# Altium schematic sheet Tarjeta Telemining V1.1 - PCB.SchDoc
size A3
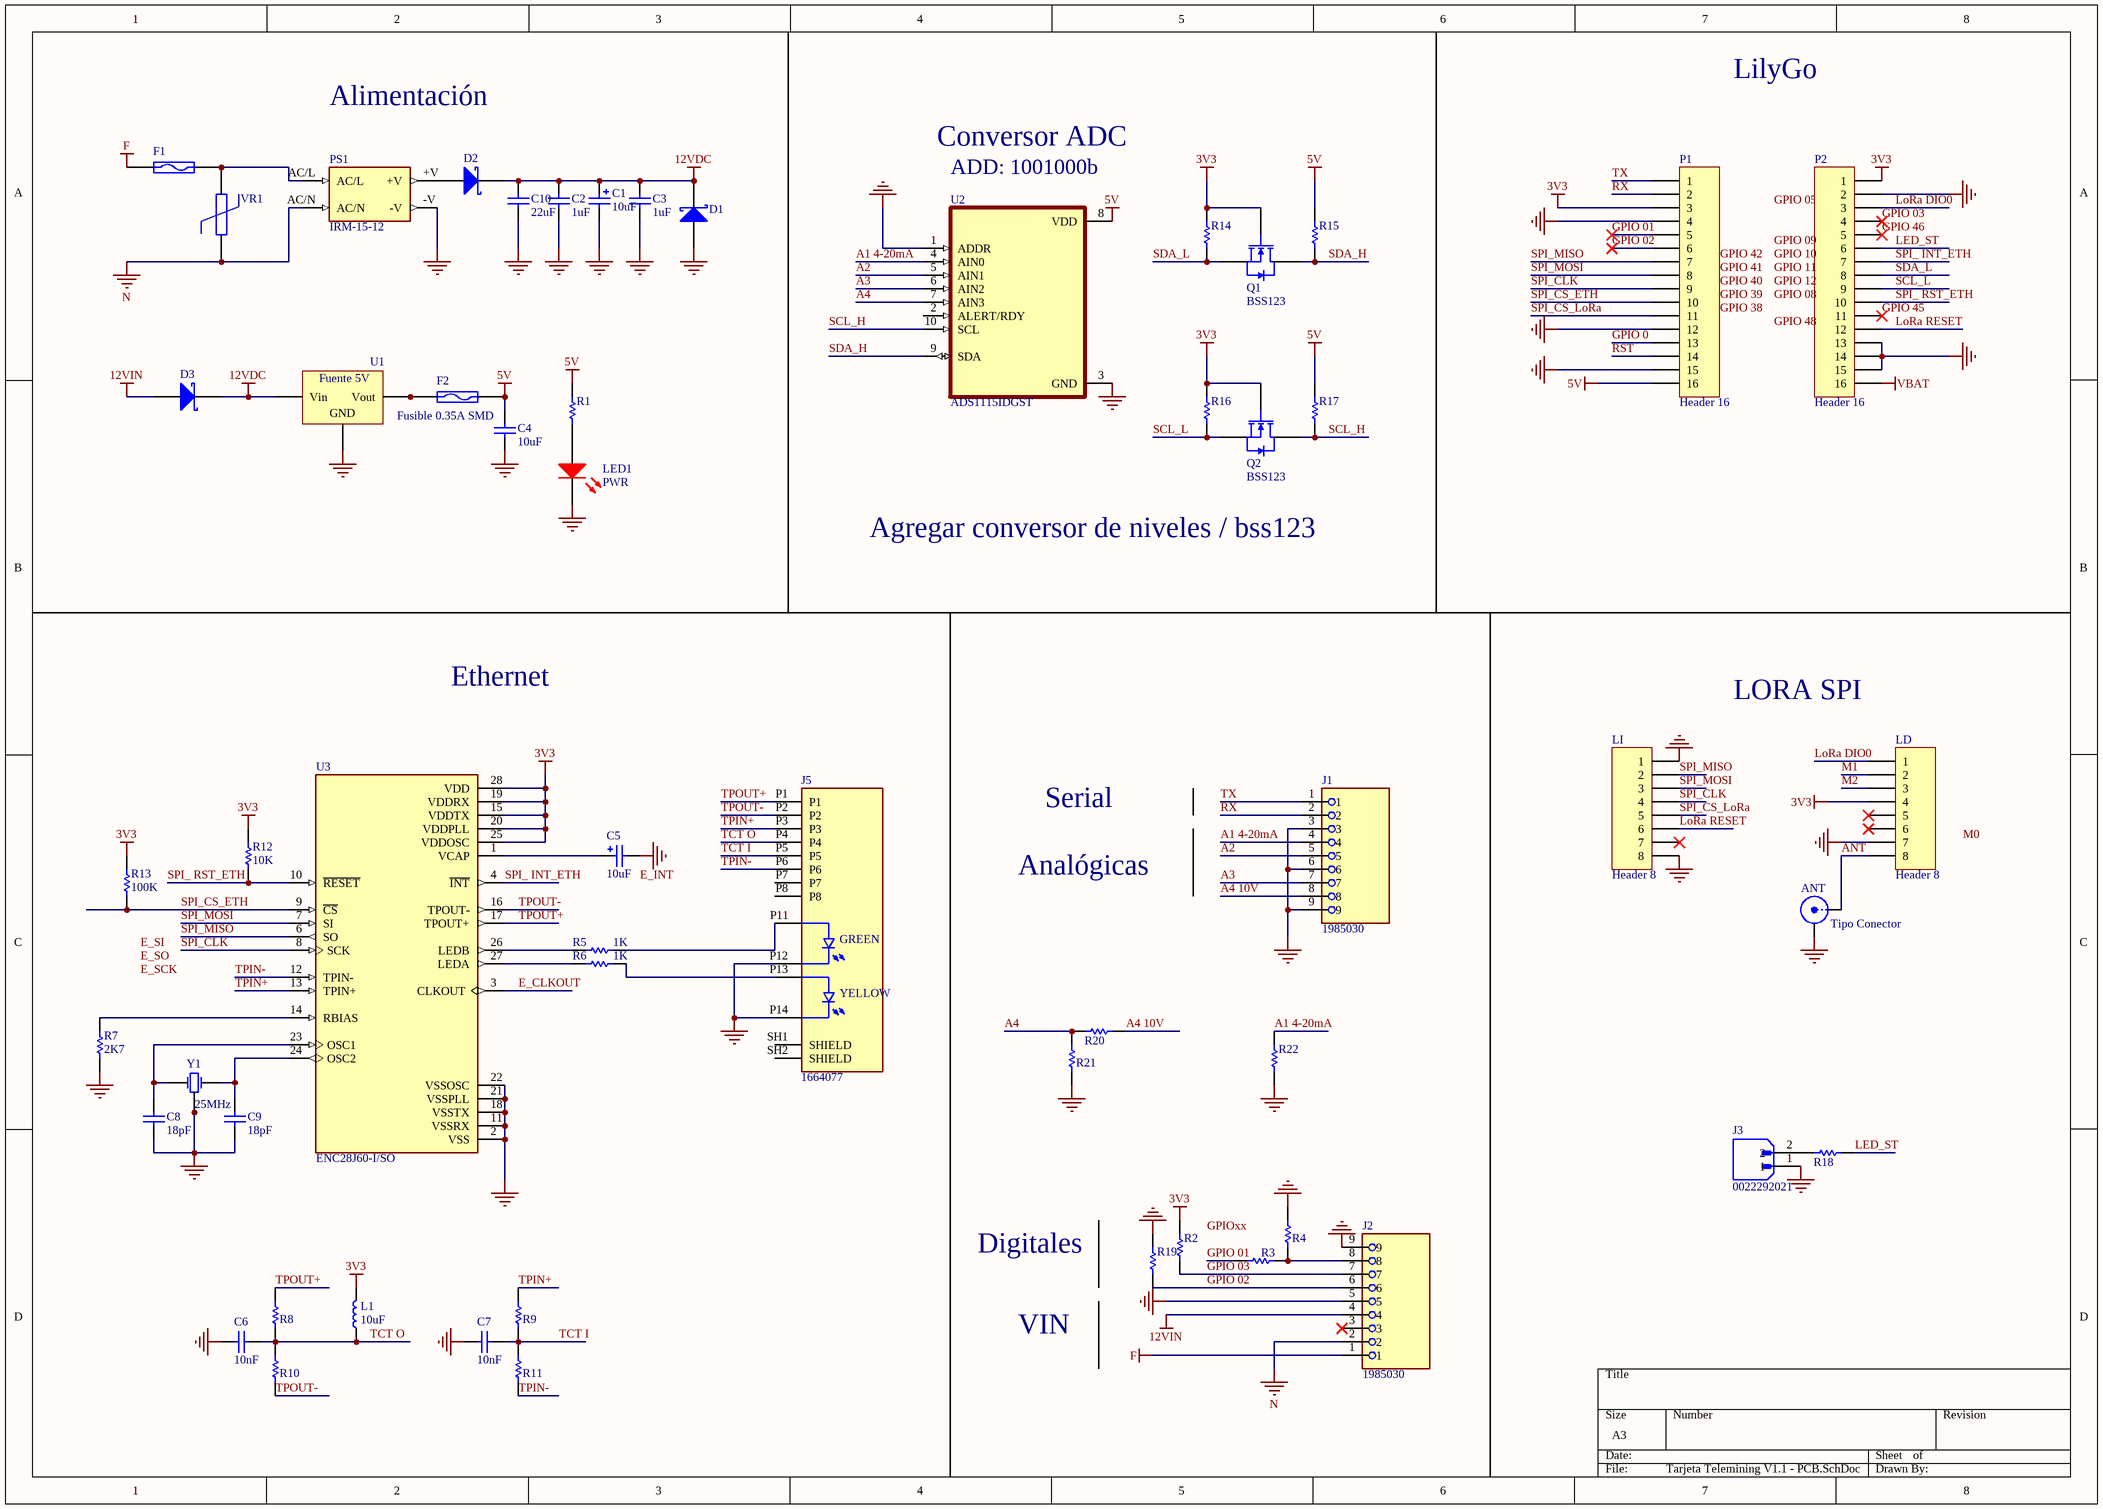
[diagram p0: Tarjeta Telemining V1.1 - PCB.SchDoc]

## Parts
ANT  Tipo Conector  [UFL]
C1  10uF  [Cap tant 10uF 1206 SMD]
C2  1uF  [Cap 1uF 0805 SMD]
C3  1uF  [Cap 1uF 0805 SMD]
C4  10uF  [Cap 10uF 1206 SMD]
C5  10uF  [Cap tant 10uF 1206 SMD]
C6  10nF  [Cap 0.1uF 0603 SMD]
C7  10nF  [Cap 0.1uF 0603 SMD]
C8  18pF  [Cap 0.1uF 0603 SMD]
C9  18pF  [Cap 0.1uF 0603 SMD]
C10  22uF  [Cap 22uF 1206 SMD]
D1  Diodo TVS SMD SMBJ20A  [Diodo TVS SMD SMBJ20A]  (value not drawn)
D2  Diodo Schottky SMD  [Diodo CDBA340-G DO-214AC SMD]  (value not drawn)
D3  Diodo Schottky SMD  [Diodo CDBA340-G DO-214AC SMD]  (value not drawn)
F1  Fuse 3A/300V TH  [Fuse 3A/300V TH]  (value not drawn)
F2  Fusible 0.35A SMD  [FUSE 0805 SMD]
J1  1985030  [PHOENIX_1985030]
J2  1985030  [PHOENIX_1985030]
J3  0022292021  [MOLEX_0022292021]
J5  1664077  [PHOENIX_1664077]
L1  10uF  [Ferrita 3A 30 Ohm 0805]
LD  Header 8  [Header M8]
LED1  PWR  [LED Rojo 0603]
LI  Header 8  [Header M8]
P1  Header 16  [HDR1X16]
P2  Header 16  [HDR1X16]
PS1  IRM-15-12  [CONV_IRM-15-12]
Q1  BSS123  [MOSFET BSS123  SMD SOT-23]
Q2  BSS123  [MOSFET BSS123  SMD SOT-23]
R1  1K  [Res 1K 0603 1/8W]  (value not drawn)
R2  1K  [Res 1K 0603 1/8W]  (value not drawn)
R3  1K  [Res 1K 0603 1/8W]  (value not drawn)
R4  1K  [Res 1K 0603 1/8W]  (value not drawn)
R5  1K  [Res 1K 0603 1/8W]
R6  1K  [Res 1K 0603 1/8W]
R7  2K7  [Res 1K 0603 1/8W]
R8  50R 1%  [Res 1K 0603 1/8W]  (value not drawn)
R9  50R 1%  [Res 1K 0603 1/8W]  (value not drawn)
R10  50R 1%  [Res 1K 0603 1/8W]  (value not drawn)
R11  50R 1%  [Res 1K 0603 1/8W]  (value not drawn)
R12  10K  [Res 1K 0603 1/8W]
R13  100K  [Res 1K 0603 1/8W]
R14  10K  [Res 1K 0603 1/8W]  (value not drawn)
R15  10K  [Res 1K 0603 1/8W]  (value not drawn)
R16  10K  [Res 1K 0603 1/8W]  (value not drawn)
R17  10K  [Res 1K 0603 1/8W]  (value not drawn)
R18  1K  [Res 1K 0603 1/8W]  (value not drawn)
R19  10K  [Res 1K 0603 1/8W]  (value not drawn)
R20  100K  [Res 1K 0603 1/8W]  (value not drawn)
R21  100K  [Res 1K 0603 1/8W]  (value not drawn)
R22  10K  [Res 1K 0603 1/8W]  (value not drawn)
U1  OKI-78SR series non-isolated switching regulator  [Reg DC/DC OKI-78SR TH]  (value not drawn)
U2  ADS1115IDGST  [SOP50P490X110-10N]
U3  ENC28J60-I/SO  [SOIC127P1030X265-28N]
VR1  VARISTOR B72210S0351K101  [VARISTOR  B72210S0351K101]  (value not drawn)
Y1  25MHz  [XTAL 24MHz SMD]

## Nets
3V3: L1.2 LD.4 P1.3 P2.1 Q1.1(G) Q2.1(G) R2.2 R12.1 R13.1 R14.2 R16.2 U3.15(VDDTX) U3.19(VDDRX) U3.20(VDDPLL) U3.25(VDDOSC) U3.28(VDD)
5V: C4.2 F2.2 P1.16 R1.2 R15.2 R17.2 U2.8(VDD)
12VDC: C1.1 C2.2 C3.2 C10.2 D1.2(K) D2.2(K) D3.2(K) U1.1(Vin)
12VIN: D3.1(A) J2.4
F: F1.1 J2.1
GND: ANT.2(Y) C1.2 C2.1 C3.1 C4.1 C5.2 C6.2 C7.2 C8.1 C9.1 C10.1 D1.1(A) J1.3 J1.6 J1.9 J2.5 J2.9 J3.1 J5.P12 J5.P14 LD.7 LED1.2(K) LI.1 LI.8 P1.4 P1.12 P1.15 P2.2 P2.13 P2.14 P2.15 PS1.-V R4.2 R7.2 R19.2 R21.2 R22.1 U1.2(GND) U2.1(ADDR) U2.3(GND) U3.2(VSS) U3.11(VSSRX) U3.18(VSSTX) U3.21(VSSPLL) U3.22(VSSOSC) Y1.2(OSC2) Y1.4(OSC2)
N: J2.2 PS1.AC/N VR1.1
VBAT: P2.16
A1 4-20mA: J1.4 R22.2 U2.4(AIN0)
A2: J1.5 U2.5(AIN1)
A3: J1.7 U2.6(AIN2)
A4: R20.1 R21.1 U2.7(AIN3)
A4 10V: J1.8 R20.2
ANT: ANT.1(X) LD.8
E_CLKOUT: U3.3(CLKOUT)
GPIO 0: P1.13
GPIO 01: P1.5 R3.2
GPIO 02: J2.6 P1.6 R19.1
GPIO 03: J2.7 P2.4 R2.1
GPIO 45: P2.11
GPIO 46: P2.5
LED_ST: P2.6 R18.2
LoRa DIO0: LD.1 P2.3
LoRa RESET: LI.6 P2.12
M1: LD.2
M2: LD.3
RST: P1.14
RX: J1.2 P1.2
SCL_H: Q2.3(D) R17.1 U2.10(SCL)
SCL_L: P2.9 Q2.2(S) R16.1
SDA_H: Q1.3(D) R15.1 U2.9(SDA)
SDA_L: P2.8 Q1.2(S) R14.1
SPI_ INT_ETH: P2.7 U3.4(~{INT})
SPI_ RST_ETH: P2.10 R12.2 U3.10(~{RESET})
SPI_CLK: LI.4 P1.9 U3.8(SCK)
SPI_CS_ETH: P1.10 R13.2 U3.9(~{CS})
SPI_CS_LoRa: LI.5 P1.11
SPI_MISO: LI.2 P1.7 U3.6(SO)
SPI_MOSI: LI.3 P1.8 U3.7(SI)
TCT I: C7.1 J5.P5 R9.1 R11.2
TCT O: C6.1 J5.P4 L1.1 R8.1 R10.2
TPIN+: J5.P3 R9.2 U3.13(TPIN+)
TPIN-: J5.P6 R11.1 U3.12(TPIN-)
TPOUT+: J5.P1 R8.2 U3.17(TPOUT+)
TPOUT-: J5.P2 R10.1 U3.16(TPOUT-)
TX: J1.1 P1.1
NetC5_1: C5.1 U3.1(VCAP)
NetC8_2: C8.2 U3.23(OSC1) Y1.1(OSC2)
NetC9_2: C9.2 U3.24(OSC2) Y1.3(OSC1)
NetD2_1: D2.1(A) PS1.+V
NetF1_2: F1.2 PS1.AC/L VR1.2
NetF2_1: F2.1 U1.3(Vout)
NetJ2_8: J2.8 R3.1 R4.1
NetJ3_2: J3.2 R18.1
NetJ5_P11: J5.P11 R5.1
NetJ5_P13: J5.P13 R6.1
NetLED1_1: LED1.1(A) R1.1
NetR5_2: R5.2 U3.26(LEDB)
NetR6_2: R6.2 U3.27(LEDA)
NetR7_1: R7.1 U3.14(RBIAS)

Not connected (* = marked no-connect by the designer): J2 3*; J5 P7 P8 SH1(SHIELD) SH2(SHIELD); LD 5* 6*; LI 7*; U2 2(ALERT/RDY)

## Notes on the sheet
- Alimentación
- LilyGo
- Conversor ADC
- (near U2) ADD: 1001000b
- Agregar conversor de niveles / bss123
- Ethernet
- LORA SPI
- Serial
- Analógicas
- (near R19) Digitales
- VIN
- Labels drawn without touching a wire or pin: E_INT, E_SCK, E_SI, E_SO, GPIO 05, GPIO 08, GPIO 09, GPIO 10, GPIO 11, GPIO 12, GPIO 38, GPIO 39, GPIO 40, GPIO 41, GPIO 42, GPIO 48, GPIOxx, M0
- (in symbol 1664077) GREEN; YELLOW
- (in symbol REG 5V 1.5A OKI 78SR) Fuente 5V

## Library data of the parts
ANT = ANTSMA
C1 C5 = Cap 10uF tantalio SMD: 10uF 16V 10%
C2 C3 = Cap 1uF SMD: 1uF 50V
C4 = Cap 10uF SMD: 10uF 25V
C6-C9 = Cap 0.1uF SMD: 0.1uF 16V
C10 = Cap 22uF SMD: 22uF 16V
D2 D3 = Diodo Schottky SMD: Schottky Rectifiers 40V 3A CDBA340-G
F2 = Fusible 0.35A SMD: PTC 0.35A 16V
J1 J2 = 1985030: MF: Phoenix Contact; Package: None; Price: None; Value: *; MP: 1985030; Availability: Unavailable
J3 = 0022292021: Connector Header Through Hole 2 position 0.100" (2.54mm); MF: {'manufacturer': u'Molex'}; Package: None; Price: None; Value: *; MP: 0022292021; Availability: Unavailable
L1 = Inductor: BEAD FERRITE 30 OHM 3A
LD LI = Header 8: Header, 8-Pin
LED1 = LED Rojo: LED Rojo 0603
P1 P2 = Header 16: https://lilygo.cc/en-us/products/t-a7608e-h?variant=43932699033781; LatestRevisionDate: 17-Jul-2002; LatestRevisionNote: Re-released for DXP Platform.; Publisher: Altium Limited
PS1 = IRM-15-12: Enclosed AC DC Converters 1 Uitgang 12V - - - 1.25A 85 ~ 305 VAC, 120 ~ 430 VDC Input; MF: MEAN WELL; MP: IRM-15-12; Value: *; SnapEDA_Link: https://www.snapeda.com/parts/IRM-15-12/MEAN+WELL+USA+Inc./view-part/?ref=snap; Price: None; Package: None; Check_prices: https://www.snapeda.com/parts/IRM-15-12/MEAN+WELL+USA+Inc./view-part/?ref=eda; Purchase-URL: https://pricing.snapeda.com/search/part/IRM-15-12/?ref=eda; Availability: In Stock
Q1 Q2 = MOSFET N-Channel_2: MOSFET N-CH 100V 170MA
R1-R22 = Res 1K SMD: 1K SMD
U1 = REG 5V 1.5A OKI 78SR: Regulator 5V 1.5A
U2 = ADS1115IDGST: 16-bit, 860-SPS, 4-channel, delta-sigma ADC with PGA, oscillator, VREF, comparator and I2C; MF: Texas Instruments; SnapEDA_Link: https://www.snapeda.com/parts/ADS1115IDGST/Texas+Instruments/view-part/?ref=snap; Package: VSSOP-10 Texas Instruments; Value: *; MP: ADS1115IDGST; Check_prices: https://www.snapeda.com/parts/ADS1115IDGST/Texas+Instruments/view-part/?ref=eda
U3 = ENC28J60-I/SO: 8 KB RAM, MAC&PHY, ETHERNET CONTROLLER, 28 PIN SOIC | Microchip Technology Inc. ENC28J60-I/SO; SnapEDA_Link: https://www.snapeda.com/parts/ENC28J60-I/SO/Microchip/view-part/?ref=snap; Package: SOIC-28 Microchip; Value: *; MF: Microchip; MP: ENC28J60-I/SO; Check_prices: https://www.snapeda.com/parts/ENC28J60-I/SO/Microchip/view-part/?ref=eda
Y1 = XTAL 24MHz: CRYSTAL 24MHZ 9PF SMD
J5 = 1664077: Package: None; Price: None; Value: *; MP: 1664077; Availability: Unavailable